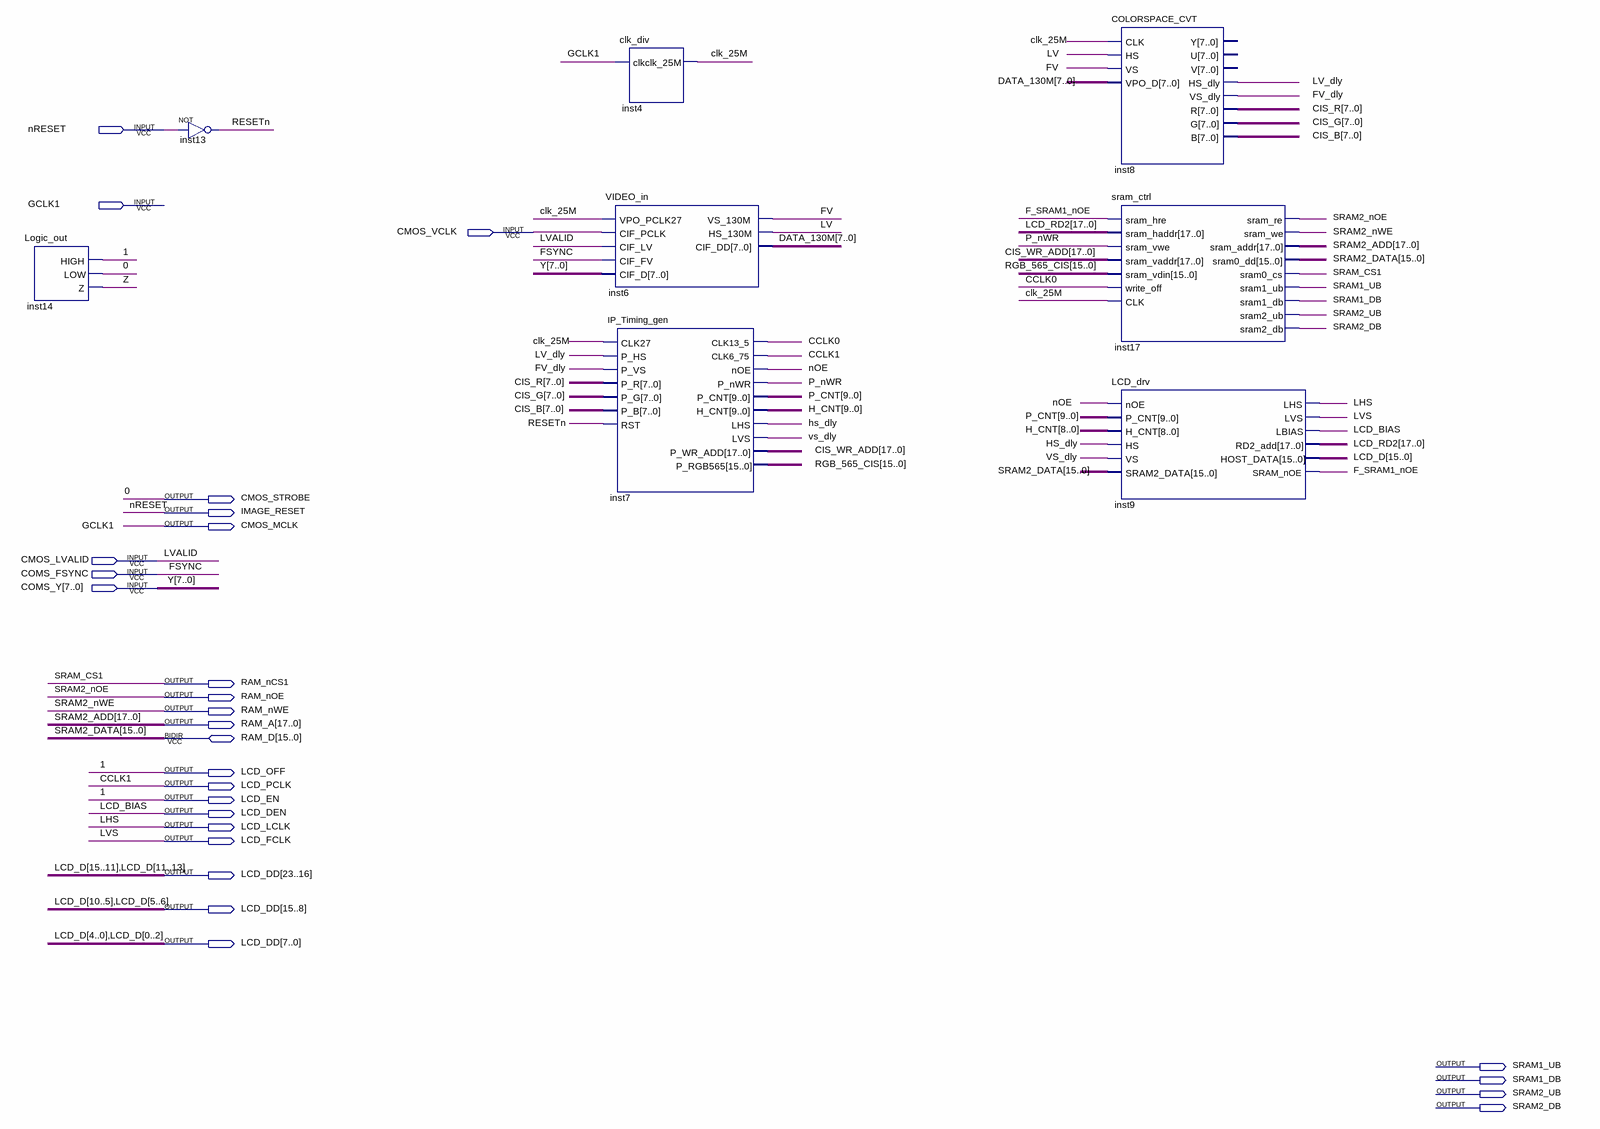
[diagram p0: schematic sheet]
// Quartus schematic M4.bdf as structural Verilog: 8 symbols, 27 pins
module M4 (
  input  nRESET,
  input  GCLK1,
  input  CMOS_VCLK,
  input  CMOS_LVALID,
  input  COMS_FSYNC,
  input  [7:0] COMS_Y,
  inout  [15:0] RAM_D,
  output CMOS_STROBE,
  output IMAGE_RESET,
  output CMOS_MCLK,
  output RAM_nCS1,
  output RAM_nOE,
  output RAM_nWE,
  output [17:0] RAM_A,
  output LCD_OFF,
  output LCD_PCLK,
  output LCD_EN,
  output LCD_DEN,
  output LCD_LCLK,
  output LCD_FCLK,
  output [23:0] LCD_DD,
  output SRAM1_UB,
  output SRAM1_DB,
  output SRAM2_UB,
  output SRAM2_DB
);

  wire CCLK0, clk_25M, F_SRAM1_nOE, FV, FV_dly, hs_dly, LV, LV_dly, nOE, P_nWR, RESETn, vs_dly, Z;
  wire [7:0] CIS_B, CIS_G, CIS_R, DATA_130M;
  wire [9:0] H_CNT, P_CNT;
  wire [15:0] RGB_565_CIS;
  wire [17:0] CIS_WR_ADD, LCD_RD2;

  Logic_out inst14 (.HIGH(LCD_EN), .LOW(CMOS_STROBE), .Z(Z));
  not inst13 (RESETn, nRESET);
  clk_div inst4 (.clk(GCLK1), .clk_25M(clk_25M));
  VIDEO_in inst6 (
    .VPO_PCLK27(clk_25M), .CIF_PCLK(CMOS_VCLK), .CIF_LV(CMOS_LVALID), .CIF_FV(COMS_FSYNC), .CIF_D(COMS_Y),
    .VS_130M(FV), .HS_130M(LV), .CIF_DD(DATA_130M));
  IP_Timing_gen inst7 (
    .CLK27(clk_25M), .P_HS(LV_dly), .P_VS(FV_dly), .P_R(CIS_R), .P_G(CIS_G), .P_B(CIS_B), .RST(RESETn),
    .CLK13_5(CCLK0), .CLK6_75(LCD_PCLK), .nOE(nOE), .P_nWR(P_nWR), .P_CNT(P_CNT), .H_CNT(H_CNT),
    .LHS(hs_dly), .LVS(vs_dly), .P_WR_ADD(CIS_WR_ADD), .P_RGB565(RGB_565_CIS));
  COLORSPACE_CVT inst8 (
    .CLK(clk_25M), .HS(LV), .VS(FV), .VPO_D(DATA_130M), .HS_dly(LV_dly), .VS_dly(FV_dly), .R(CIS_R),
    .G(CIS_G), .B(CIS_B));  // open: Y, U, V
  sram_ctrl inst17 (
    .sram_hre(F_SRAM1_nOE), .sram_haddr(LCD_RD2), .sram_vwe(P_nWR), .sram_vaddr(CIS_WR_ADD),
    .sram_vdin(RGB_565_CIS), .write_off(CCLK0), .CLK(clk_25M), .sram_re(RAM_nOE), .sram_we(RAM_nWE),
    .sram_addr(RAM_A), .sram0_cs(RAM_nCS1), .sram1_ub(SRAM1_UB), .sram1_db(SRAM1_DB), .sram2_ub(SRAM2_UB),
    .sram2_db(SRAM2_DB), .sram0_dd(RAM_D));
  LCD_drv inst9 (
    .nOE(nOE), .P_CNT(P_CNT), .H_CNT(H_CNT[8:0]), .HS(hs_dly), .VS(vs_dly), .SRAM2_DATA(RAM_D),
    .LHS(LCD_LCLK), .LVS(LCD_FCLK), .LBIAS(LCD_DEN), .RD2_add(LCD_RD2),
    .HOST_DATA({LCD_DD[23:19], LCD_DD[15:10], LCD_DD[7:3]}), .SRAM_nOE(F_SRAM1_nOE));

  assign CMOS_MCLK = GCLK1;
  assign IMAGE_RESET = nRESET;
  assign {LCD_DD[18:16], LCD_DD[9:8], LCD_DD[2:0]} = {LCD_DD[19], LCD_DD[20], LCD_DD[21], LCD_DD[10], LCD_DD[11], LCD_DD[3], LCD_DD[4], LCD_DD[5]};
  assign LCD_OFF = LCD_EN;

  // Other names for the same wires on the sheet: 0 = CMOS_STROBE; 1 = LCD_EN; CCLK1 = LCD_PCLK; FSYNC = COMS_FSYNC;
  //   LCD_BIAS = LCD_DEN; LCD_D[15:0] = {LCD_DD[23:19], LCD_DD[15:10], LCD_DD[7:3]}; LHS = LCD_LCLK;
  //   LVALID = CMOS_LVALID; LVS = LCD_FCLK; SRAM2_ADD[17:0] = RAM_A; SRAM2_DATA[15:0] = RAM_D; SRAM2_nOE = RAM_nOE;
  //   SRAM2_nWE = RAM_nWE; SRAM_CS1 = RAM_nCS1; Y[7:0] = COMS_Y
endmodule
